# Altium project SEMG.PrjPcb
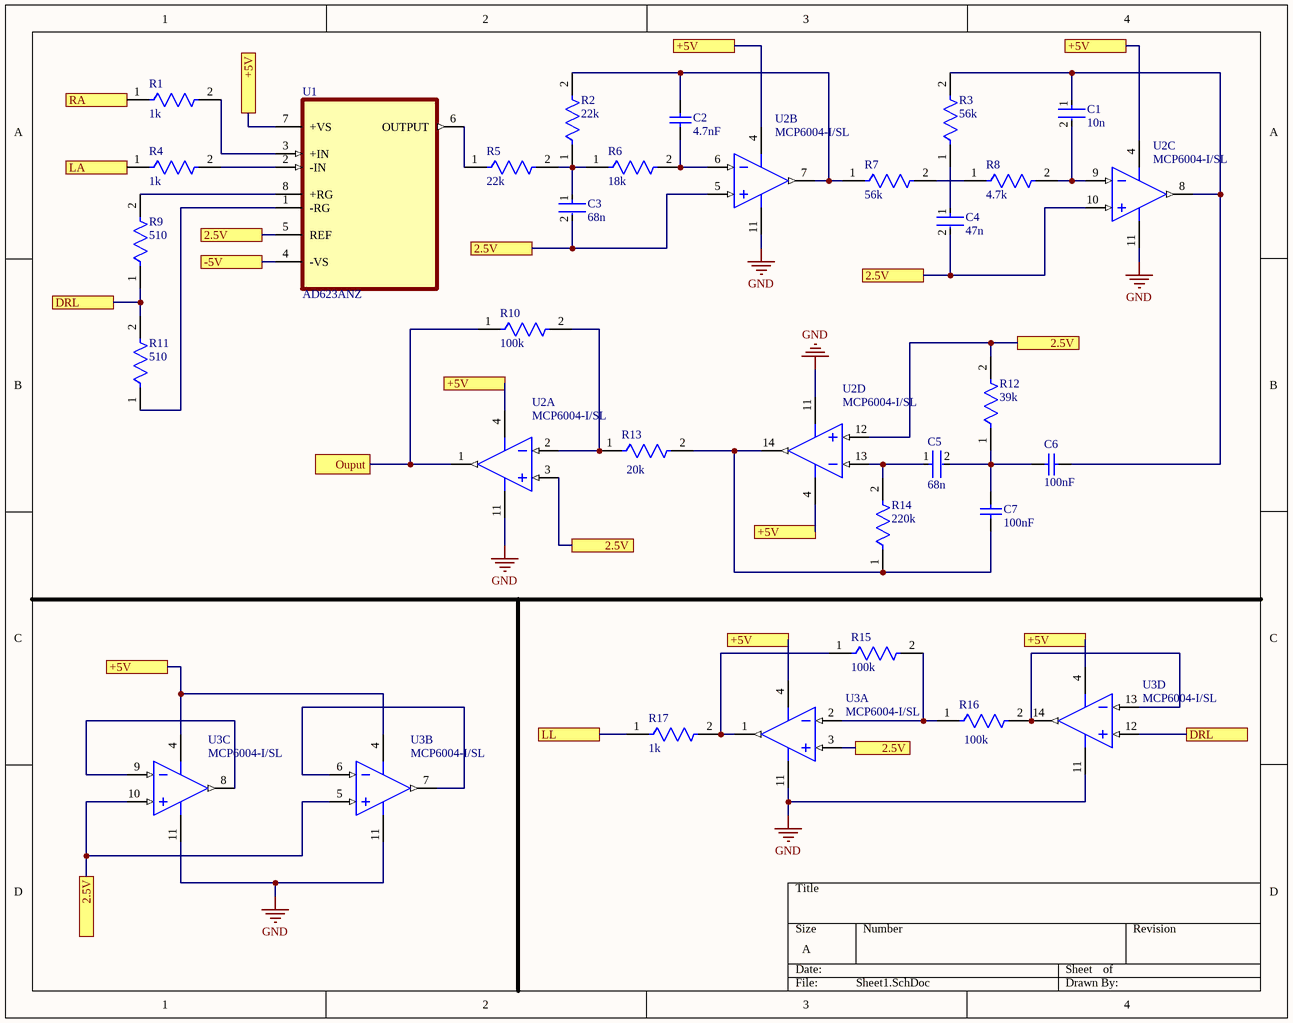
[diagram p0: Sheet1.SchDoc]
3 sheets, 69 parts. Net scope: flat (ports and power ports of the same name join across sheets).
Board file: PCB1.PcbDoc
Sheets:
  Sheet1.SchDoc
  Sheet2.SchDoc
  Sheet3.SchDoc

## Sheet Sheet1.SchDoc
size A; SheetNumber: 1; SheetTotal: 3

### Parts
C1  10n  [FP-C1206C-EB-MFG]
C2  4.7nF  [CAPC1206(3216)170_M]
C3  68n  [FP-C1206C-EB-MFG]
C4  47n  [FP-C1206C-EB-MFG]
C5  68n  [FP-C1206C-EB-MFG]
C6  100nF  [CAPC1210(3225)115_M]
C7  100nF  [CAPC1210(3225)115_M]
R1  1k  [FP-ESR03-IPC_A]
R2  22k  [FP-CRGP0603-IPC_C]
R3  56k  [FP-ESR03-IPC_C]
R4  1k  [FP-ESR03-IPC_A]
R5  22k  [FP-CRGP0603-IPC_C]
R6  18k  [FP-ESR03-MFG]
R7  56k  [FP-ESR03-IPC_C]
R8  4.7k  [FP-CRGP0603-IPC_C]
R9  510  [FP-ESR03-IPC_A]
R10  100k  [FP-CRGP0603-IPC_C]
R11  510  [FP-ESR03-IPC_A]
R12  39k  [FP-CRGP0603-IPC_C]
R13  20k  [FP-ESR03-IPC_A]
R14  220k  [FP-ESR03-MFG]
R15  100k  [FP-CRGP0603-IPC_C]
R16  100k  [FP-CRGP0603-IPC_C]
R17  1k  [FP-ESR03-IPC_A]
U1  AD623ANZ  [DIP254P762X533-8]
U2  MCP6004-I/SL  [SOIC-SL14_M]  (parts A,B,C,D of 4)
U3  MCP6004-I/SL  [SOIC-SL14_M]  (parts A,B,C,D of 4)

### Ports
2.5V, +5V, -5V, DRL, LA, LL, Ouput, RA

### Nets
GND: U2.11(VSS) U3.11(VSS)
NetC1_1: C1.1 C6.2 R3.2 U2.8(VOUTC)
NetC1_2: C1.2 R8.2 U2.9(VINC-)
NetC2_1: C2.1 R6.2 U2.6(VINB-)
NetC2_2: C2.2 R2.2 R7.1 U2.7(VOUTB)
NetC3_1: C3.1 R2.1 R5.2 R6.1
NetC3_2: C3.2 C4.2 R12.2 U1.5(REF) U2.3(VINA+) U2.5(VINB+) U2.10(VINC+) U2.12(VIND+) U3.3(VINA+) U3.5(VINB+) U3.10(VINC+) ; port 2.5V
NetC4_1: C4.1 R3.1
NetC5_1: C5.1 R14.2 U2.13(VIND-)
NetC5_2: C5.2 C6.1 C7.2 R12.1
NetC7_1: C7.1 R13.2 R14.1 U2.14(VOUTD)
NetC8_1: U1.7(+VS) U2.4(VDD) U3.4(VDD) ; port +5V
NetC16_2: U1.4(-VS) ; port -5V
NetJ1_7: R10.1 U2.1(VOUTA) ; port Ouput
NetJ4_1: R17.1 ; port LL
NetJ4_2: R4.1 ; port LA
NetJ4_3: R1.1 ; port RA
NetR1_2: R1.2 U1.3(+IN)
NetR4_2: R4.2 U1.2(-IN)
NetR5_1: R5.1 U1.6(OUTPUT)
NetR7_2: R7.2 R8.1
NetR9_1: R9.1 R11.2 U3.12(VIND+) ; port DRL
NetR9_2: R9.2 U1.8(+RG)
NetR10_2: R10.2 R13.1 U2.2(VINA-)
NetR11_1: R11.1 U1.1(-RG)
NetR15_1: R15.1 R17.2 U3.1(VOUTA)
NetR15_2: R15.2 R16.1 U3.2(VINA-)
NetR16_2: R16.2 U3.13(VIND-) U3.14(VOUTD)
NetU3_6: U3.6(VINB-) U3.7(VOUTB)
NetU3_8: U3.8(VOUTC) U3.9(VINC-)

### Library data of the parts
C1 = CMP-1037-03498-2: CAP CER 10000PF 50V NP0 1206; Manufacturer: KEMET; Manufacturer Part Number: C1206C103F5GACTU; Value: 10,000 pF; Material: Ceramic; Temperature Characteristic: C0G; Tolerance: 0.01; Automotive Grade: Grade 0; Temperature Coefficient: 15%; Digikey Description: CAP CER 10000PF 50V NP0 1206; Device Class L1: Passive Components; Device Class L2: Capacitors; Capacitance: 10,000 pF; Octopart: https://octopart.com/c1206c103f5gactu-kemet-19050582; Voltage Rating: 50 V; Height: 0.88mm; ComponentLink2Description: Datasheet; ComponentLink2URL: https://content.kemet.com/datasheets/KEM_C1007_X8R_ULTRA_150C_SMD.pdf; Lead Free: Yes; Temperature Range Low: -55°C; Ipc Land Pattern Name: CAPC320160X78; RoHS: TRUE; Temperature: -55°C to +150°C; Category: Cap; Package: C1206C-EB; Temperature Range High: +150°C; Automotive: Yes; Device Class L3: Ceramic Capacitors
C2 = CMP-1037-03108-1: CAP 4.7nF 50V ±1% 1206 (3216 Metric) Thickness 1.7mm SMD; Tolerance: Â±1%; Case-EIA: 1206; Case-Metric: 3216; Rated Voltage: 50 V; Technology: SMT; Value: 4.7nF; Max Thickness: 1.7 mm
C3 C5 = CMP-1037-04086-2: CAP CER 0.068UF 50V NP0 1206; Manufacturer Part Number: C1206C683F5GACTU; Manufacturer: KEMET; Temperature Characteristic: C0G; Tolerance: 0.01; Temperature Coefficient: 15%; Value: 68,000 pF; Automotive Grade: Grade 0; Material: Ceramic; ComponentLink2Description: Datasheet; Lead Free: Yes; Voltage Rating: 50 V; RoHS: TRUE; ComponentLink2URL: https://content.kemet.com/datasheets/KEM_C1007_X8R_ULTRA_150C_SMD.pdf; Device Class L2: Capacitors; Category: Cap; Height: 0.88mm; Device Class L3: Ceramic Capacitors; Mouser Description: Multilayer Ceramic Capacitors MLCC - SMD/SMT 50volts 0.068uF 1% C0G; Octopart: https://octopart.com/c1206c683f5gactu-kemet-19050752; Package: C1206C-EB; Automotive: Yes; Temperature Range High: +150°C; Temperature: -55°C to +150°C; Device Class L1: Passive Components; Digikey Description: CAP CER 0.068UF 50V NP0 1206; Capacitance: 68,000 pF; Ipc Land Pattern Name: CAPC320160X78; Temperature Range Low: -55°C
C4 = CMP-1037-03977-2: CAP CER 0.047UF 50V NP0 1206; Manufacturer: KEMET; Manufacturer Part Number: C1206C473F5GACTU; Tolerance: 0.01; Automotive Grade: Grade 0; Value: 47,000 pF; Material: Ceramic; Temperature Coefficient: 15%; Temperature Characteristic: C0G; Device Class L1: Passive Components; Lead Free: Yes; Voltage Rating: 50 V; ComponentLink2URL: https://content.kemet.com/datasheets/KEM_C1007_X8R_ULTRA_150C_SMD.pdf; Device Class L2: Capacitors; Capacitance: 47,000 pF; Temperature Range High: +150°C; RoHS: TRUE; Temperature Range Low: -55°C; Category: Cap; Mouser Description: Multilayer Ceramic Capacitors MLCC - SMD/SMT 50volts 0.047uF 1% C0G; Height: 0.88mm; Device Class L3: Ceramic Capacitors; ComponentLink2Description: Datasheet; Octopart: https://octopart.com/c1206c473f5gactu-kemet-13140371; Digikey Description: CAP CER 0.047UF 50V NP0 1206; Package: C1206C-EB; Automotive: Yes; Temperature: -55°C to +150°C; Ipc Land Pattern Name: CAPC320160X78
C6 C7 = CMP-1038-01632-1: CAP 100nF 16V ±1% 1210 (3225 Metric) Thickness 1.1mm SMD; Case-Metric: 3225; Tolerance: Â±1%; Case-EIA: 1210; Value: 100nF; Technology: SMT; Max Thickness: 1.1 mm; Rated Voltage: 16 V
R1 R4 R17 = CMP-08839-029483-1: 1kΩ ±1% 0.25W 0603 Anti-Surge Chip Resistor AEC-Q200; Power Rating: 250mW; Resistance: 1kR; Temperature Coefficient: 100ppm/°C; Series: ESR; Max Operating Temperature: 155°C; Case Code (Metric): 1608; Package Quantity: 1; Case/Package: 0603; Size Code: 0603; Case Code (Imperial): 0603; Min Operating Temperature: -55°C; Tolerance: 1%; Max Power Dissipation: 250mW; Number of Terminations: 2; RoHS Compliant: Yes; Lead Free: Lead Free; Packaging: Tape and Reel; Height: 0.022inch; Width: 0.031inch; Features: Automotive AEC-Q200; Resistor Type: Thick Film; Length: 0.063inch
R2 R5 = CMP-03211-006681-1: CRGP 0603 22K 1%; Manufacturer Part Number: CRGP0603F22K; Manufacturer: TE; Resistance: 22KΩ; Power Rating: 0.25W; Temperature Coefficient: ±100ppm/°C; Tolerance: 0.01; Voltage Rating: 50V; Value: 22KΩ; Lead Free: Yes; Device Class L3: Chip SMD Resistors; Ipc Land Pattern Name: RESC16080X45; Composition: Thick Film; Octopart: https://octopart.com/crgp0603f22k-te+connectivity-91018742; RoHS: TRUE; ComponentLink2Description: Datasheet; Digikey Description: CRGP 0603 22K 1%; Category: Res; Temperature: -55°C to +155°C; Temperature Range High: +155°C; Series: CRGP; ComponentLink2URL: https://www.te.com/commerce/DocumentDelivery/DDEController?Action=srchrtrv&DocNm=9-1773463-9&DocType=DS&DocLang=English; Device Class L2: Resistors; Height: 0.55mm; Ambient Temperature Range High: +70°C; Device Class L1: Passive Components; Automotive: No; Temperature Range Low: -55°C; Package: CRGP0603
R3 R7 = CMP-08839-002556-1: 56kΩ ±1% 0.25W 0603 Anti-Surge Chip Resistor AEC-Q200; Temperature Coefficient: 100ppm/°C; Max Power Dissipation: 250mW; Resistance: 56kR; Series: ESR; Packaging: Tape and Reel; Features: Automotive AEC-Q200; Min Operating Temperature: -55°C; Tolerance: 1%; RoHS Compliant: Yes; Case/Package: 0603; Resistor Type: Thick Film; Max Operating Temperature: 155°C; Number of Terminations: 2
R6 = CMP-08839-007579-1: 18kΩ ±1% 0.25W 0603 Anti-Surge Chip Resistor AEC-Q200; Temperature Coefficient: 100ppm/°C; Max Power Dissipation: 250mW; Resistance: 18kR; Max Operating Temperature: 155°C; Height: 0.022inch; Packaging: Tape and Reel; Package Quantity: 5000; Number of Terminations: 2; RoHS Compliant: Yes; Width: 0.031inch; Series: ESR03; Case/Package: 0603; Resistor Type: Thick Film; Min Operating Temperature: -55°C; Tolerance: 1%; Length: 0.063inch
R8 = CMP-03211-002408-1: CRGP0603 4.7KΩ 0.25W ±100ppm/°C 1% 50V; Manufacturer Part Number: CRGP0603F4K7; Manufacturer: TE; Tolerance: 0.01; Device Class L1: Passive Components; Temperature Range High: +155°C; Value: 4.7KΩ; ComponentLink2Description: Datasheet; Resistance: 4.7KΩ; RoHS: TRUE; Octopart: https://octopart.com/crgp0603f4k7-te+connectivity-91018764; Ipc Land Pattern Name: RESC16080X45; Lead Free: Yes; Temperature: -55°C to +155°C; Power Rating: 0.25W; Category: Res; Package: CRGP0603; Voltage Rating: 50V; ComponentLink2URL: https://www.te.com/commerce/DocumentDelivery/DDEController?Action=srchrtrv&DocNm=9-1773463-9&DocType=DS&DocLang=English; Temperature Coefficient: ±100ppm/°C; Height: 0.55mm; Automotive: No; Temperature Range Low: -55°C; Device Class L2: Resistors; Series: CRGP; Composition: Thick Film; Device Class L3: Chip SMD Resistors; Ambient Temperature Range High: +70°C
R9 = CMP-08839-005099-1: 510Ω ±1% 0.25W 0603 Anti-Surge Chip Resistor AEC-Q200; Resistance: 510R; Max Power Dissipation: 250mW; Temperature Coefficient: 100ppm/°C; Series: ESR; Min Operating Temperature: -55°C; Resistor Type: Thick Film; Case/Package: 0603; Packaging: Tape and Reel; Tolerance: 1%; Features: Automotive AEC-Q200; Number of Terminations: 2; Max Operating Temperature: 155°C
R10 R15 R16 = CMP-03211-000885-1: CRGP 0603 100K 1%; Manufacturer: TE; Manufacturer Part Number: CRGP0603F100K; Power Rating: 0.25W; Resistance: 100KΩ; Voltage Rating: 50V; Value: 100KΩ; Tolerance: 0.01; Temperature Coefficient: ±100ppm/°C; Device Class L2: Resistors; Temperature: -55°C to +155°C; Temperature Range High: +155°C; Ambient Temperature Range High: +70°C; Lead Free: Yes; RoHS: TRUE; Octopart: https://octopart.com/crgp0603f100k-te+connectivity-91018719; Digikey Description: CRGP 0603 100K 1%; Automotive: No; ComponentLink2Description: Datasheet; Category: Res; Ipc Land Pattern Name: RESC16080X45; Device Class L3: Chip SMD Resistors; Composition: Thick Film; Temperature Range Low: -55°C; Height: 0.55mm; Device Class L1: Passive Components; Series: CRGP; Package: CRGP0603; ComponentLink2URL: https://www.te.com/commerce/DocumentDelivery/DDEController?Action=srchrtrv&DocNm=9-1773463-9&DocType=DS&DocLang=English
R11 = CMP-08839-005099-1: Resistance: 510R; Max Power Dissipation: 250mW; Tolerance: 1%; Temperature Coefficient: 100ppm/°C; Series: ESR; Min Operating Temperature: -55°C; Resistor Type: Thick Film; Case/Package: 0603; Packaging: Tape and Reel; Features: Automotive AEC-Q200; Number of Terminations: 2; Max Operating Temperature: 155°C
R12 = CMP-03211-000998-1: CRGP0603 39KΩ 0.25W ±100ppm/°C 1% 50V; Manufacturer: TE; Manufacturer Part Number: CRGP0603F39K; Tolerance: 0.01; Package: CRGP0603; Temperature: -55°C to +155°C; Device Class L1: Passive Components; Value: 39KΩ; RoHS: TRUE; Device Class L3: Chip SMD Resistors; Octopart: https://octopart.com/crgp0603f39k-te+connectivity-91018756; Resistance: 39KΩ; Automotive: No; Lead Free: Yes; Height: 0.55mm; Category: Res; Series: CRGP; Temperature Range High: +155°C; Temperature Coefficient: ±100ppm/°C; Composition: Thick Film; Temperature Range Low: -55°C; ComponentLink2URL: https://www.te.com/commerce/DocumentDelivery/DDEController?Action=srchrtrv&DocNm=9-1773463-9&DocType=DS&DocLang=English; ComponentLink2Description: Datasheet; Device Class L2: Resistors; Ambient Temperature Range High: +70°C; Ipc Land Pattern Name: RESC16080X45; Power Rating: 0.25W; Voltage Rating: 50V
R13 = CMP-08839-029148-1: 20kΩ ±1% 0.25W 0603 Anti-Surge Chip Resistor AEC-Q200; Resistance: 20kR; Max Power Dissipation: 250mW; Temperature Coefficient: 100ppm/°C; Max Operating Temperature: 155°C; RoHS Compliant: Yes; Length: 0.063inch; Number of Terminations: 2; Tolerance: 1%; Height: 0.022inch; Width: 0.031inch; Case Code (Metric): 1608; Min Operating Temperature: -55°C; Case/Package: 0603; Case Code (Imperial): 0603; Packaging: Tape and Reel; Resistor Type: Thick Film; Package Quantity: 1; Features: Automotive AEC-Q200; Series: ESR
R14 = CMP-08839-027973-1: 220kΩ ±1% 0.25W 0603 Anti-Surge Chip Resistor AEC-Q200; Max Power Dissipation: 250mW; Temperature Coefficient: 100ppm/°C; Resistance: 220kR; Number of Terminations: 2; Packaging: Tape and Reel; Tolerance: 1%; Height: 0.022inch; Case Code (Imperial): 0603; Min Operating Temperature: -55°C; Package Quantity: 1; Features: Automotive AEC-Q200; Resistor Type: Thick Film; RoHS Compliant: Yes; Width: 0.031inch; Length: 0.063inch; Max Operating Temperature: 155°C; Series: ESR; Case/Package: 0603; Case Code (Metric): 1608
U1 = AD623ANZ: Single and Dual-Supply, Rail-to-Rail, Low Cost Instrumentation Amplifier; MF: Analog Devices; SnapEDA_Link: https://www.snapeda.com/parts/AD623ANZ/Analog+Devices/view-part/?ref=snap; Package: PDIP-8 Analog Devices; Value: *; MP: AD623ANZ; Check_prices: https://www.snapeda.com/parts/AD623ANZ/Analog+Devices/view-part/?ref=eda
U2 U3 = CMP-0187-00321-3: None; Number of Channels: 4; Amplifier Type: GENERAL PURPOSE; Common Mode Rejection Ratio: 60dB; Bandwidth: 1MHz; Voltage Gain: 112dB; Min Supply Voltage: 1.8V; Slew Rate-Nom: 0.6V/µs; Supply Current: 100uA; Input Offset Voltage-Max: 4.5mV; Power Supply Rejection Ratio (PSRR): 86dB; Output Current: 23mA; Operating Supply Voltage: 5.5V; Input Bias Current: 1pA; Max Supply Voltage: 6V; RoHS Compliant: Yes; Technology: CMOS; Radiation Hardening: No; Number of Elements: 4; REACH SVHC: No SVHC; Number of Amplifiers: 4; Lead Free: Lead Free; Contact Plating: Tin; Max Operating Temperature: 85°C; Packaging: Rail/Tube; Number of Pins: 14; Case/Package: SOIC; Width: 3.9mm; Length: 8.65mm; Unity Gain Bandwidth Product: 1MHz; Gain Bandwidth Product: 1MHz; Input Offset Voltage (Vos): 4.5mV; Package Quantity: 57; Number of Circuits: 4; Min Operating Temperature: -40°C; Nominal Supply Current: 100uA; Height: 1.25mm; Slew Rate: 0.6V/µs; Mount: Surface Mount

## Sheet Sheet2.SchDoc
size A; SheetNumber: 2; SheetTotal: 3
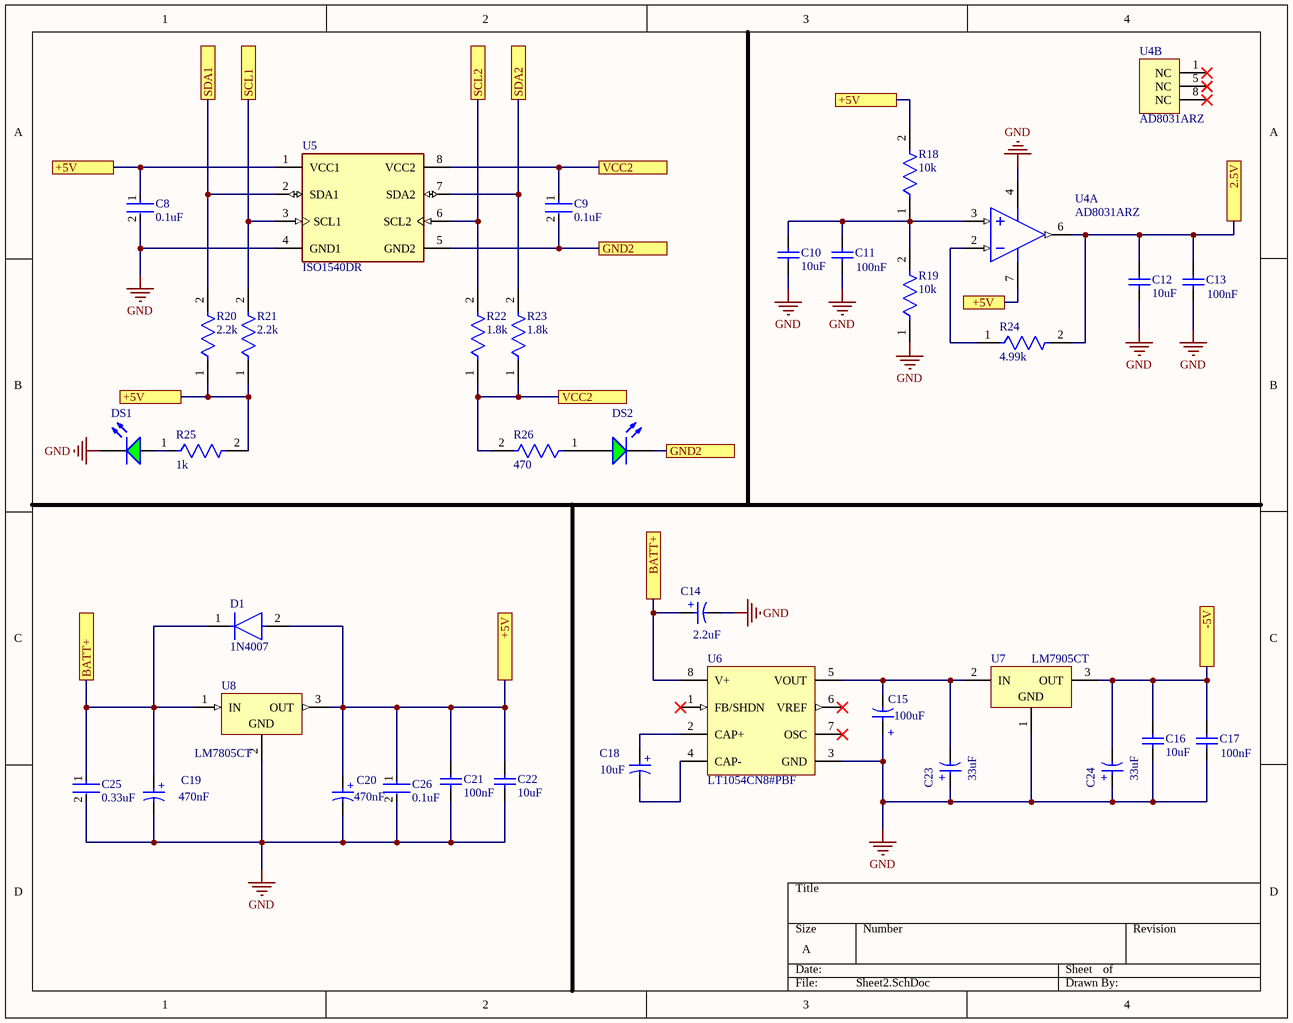
[diagram p1: Sheet2.SchDoc]

### Parts
C8  0.1uF  [FP-C1206C-EB-MFG]
C9  0.1uF  [FP-C1206C-EB-MFG]
C10  10uF  [CAPC1210(3225)230_M]
C11  100nF  [CAPC1210(3225)190_L]
C12  10uF  [CAPC1210(3225)230_M]
C13  100nF  [CAPC1210(3225)190_L]
C14  2.2uF  [WCAP-ATG8_D5H11]
C15  100uF  [WCAP-PTG5_D8H11.5]
C16  10uF  [CAPC1210(3225)230_M]
C17  100nF  [CAPC1210(3225)190_L]
C18  10uF  [WCAP-ATG5_D5H11]
C19  470nF  [WCAP-ATG5_D5H11]
C20  470nF  [WCAP-ATG5_D5H11]
C21  100nF  [CAPC1210(3225)190_L]
C22  10uF  [CAPC1210(3225)230_M]
C23  33uF  [WCAP-ATG5_D5H11]
C24  33uF  [WCAP-ATG5_D5H11]
C25  0.33uF  [FP-C0805C-DN-MFG]
C26  0.1uF  [FP-C1206C-EB-MFG]
D1  1N4007  [FP-1N4007-MFG]
DS1  (no value)  [LTST-C230KGKT_V]
DS2  (no value)  [LTST-C230KGKT_V]
R18  10k  [FP-ERJPA3-IPC_A]
R19  10k  [FP-ERJPA3-IPC_A]
R20  2.2k  [FP-ESR03-IPC_C]
R21  2.2k  [FP-ESR03-IPC_C]
R22  1.8k  [FP-ESR03-IPC_C]
R23  1.8k  [FP-ESR03-IPC_C]
R24  4.99k  [FP-AC1206-MFG]
R25  1k  [FP-ESR03-IPC_A]
R26  470  [FP-CRGP0603-IPC_C]
U4  AD8031ARZ  [ADI-R-8_L]  (parts A,B of 2)
U5  ISO1540DR  [FP-D0008A-MFG]
U6  LT1054CN8#PBF  [LT-N8-8]
U7  LM7905CT  [NDE0003A]
U8  LM7805CT  [FAIR-TO-220-3]

### Ports
2.5V, +5V, -5V, BATT+, GND2, SCL1, SCL2, SDA1, SDA2, VCC2

### Nets
GND: C8.2 C10.1 C11.1 C12.1 C13.1 C14.2(N) C15.1(P) C16.1 C17.1 C19.2(N) C20.2(N) C21.1 C22.1 C23.1(P) C24.1(P) C25.2 C26.2 DS1.2(K) R19.1 U4.4(-VS) U5.4(GND1) U6.3(GND) U7.1(GND) U8.2(GND)
NetC3_2: C12.2 C13.2 R24.2 U4.6(OUT) ; port 2.5V
NetC8_1: C8.1 C20.1(P) C21.2 C22.2 C26.1 D1.2(A) R18.2 R20.1 R21.1 R25.2 U4.7(+VS) U5.1(VCC1) U8.3(OUT) ; port +5V
NetC9_1: C9.1 R22.1 R23.1 R26.2 U5.8(VCC2) ; port VCC2
NetC9_2: C9.2 DS2.2(K) U5.5(GND2) ; port GND2
NetC10_2: C10.2 C11.2 R18.1 R19.2 U4.3(+IN)
NetC14_1: C14.1(P) C19.1(P) C25.1 D1.1(C) U6.8(V+) U8.1(IN) ; port BATT+
NetC15_2: C15.2(N) C23.2(N) U6.5(VOUT) U7.2(IN)
NetC16_2: C16.2 C17.2 C24.2(N) U7.3(OUT) ; port -5V
NetC18_1: C18.1(P) U6.2(CAP+)
NetC18_2: C18.2(N) U6.4(CAP-)
NetDS1_1: DS1.1(A) R25.1
NetDS2_1: DS2.1(A) R26.1
NetJ1_3: R21.2 U5.3(SCL1) ; port SCL1
NetJ1_4: R20.2 U5.2(SDA1) ; port SDA1
NetJ3_3: R23.2 U5.7(SDA2) ; port SDA2
NetJ3_4: R22.2 U5.6(SCL2) ; port SCL2
NetR24_1: R24.1 U4.2(-IN)

Not connected (* = marked no-connect by the designer): U4 1(NC)* 5(NC)* 8(NC)*; U6 1(FB/SHDN)* 6(VREF)* 7(OSC)*

### Notes on the sheet
- (in symbol CMP-03913-53914227-2) +
- (in symbol CMP-03913-53914235-2) +
- (in symbol CMP-03913-53914252-2) +
- (in symbol CMP-03913-54007285-2) +
- (in symbol CMP-03913-54202572-2) +

### Library data of the parts
C8 C9 C26 = CMP-03020-004485-1: C1206 0.10 μF U2J 1.00% 25 V; Manufacturer: KEMET; Manufacturer Part Number: C1206C104F3JACAUTO; Value: 0.10 μF; Material: Ceramic; Voltage Rating: 25 V; Tolerance: 0.01; Temperature Coefficient: 15%; Automotive Grade: Grade 0; Temperature Range Low: -55°C; Temperature: -55°C to +150°C; Octopart: https://octopart.com/c1206c104f3jacauto-kemet-84732508; Device Class L3: Ceramic Capacitors; Category: Cap; Device Class L1: Passive Components; Package: C1206C-EB; Device Class L2: Capacitors; Height: 0.88mm; Automotive: Yes; Ipc Land Pattern Name: CAPC320160X78; Temperature Range High: +150°C; Capacitance: 0.10 μF; RoHS: TRUE; Temperature Characteristic: U2J; ComponentLink2Description: Datasheet; Lead Free: Yes; ComponentLink2URL: https://content.kemet.com/datasheets/KEM_C1007_X8R_ULTRA_150C_SMD.pdf
C10 C12 C16 C22 = CMP-1038-02200-3: CAP 10uF 10V ±20% 1210 (3225 Metric) Thickness 2.2mm SMD; Tolerance: Â±20%; Case-Metric: 3225; Case-EIA: 1210; Max Thickness: 2.2 mm; Technology: SMT; Value: 10uF; Rated Voltage: 10 V
C11 C13 C17 C21 = CMP-1038-01673-1: CAP 100nF 100V ±20% 1210 (3225 Metric) Thickness 1.9mm SMD; Case-EIA: 1210; Case-Metric: 3225; Tolerance: Â±20%; Technology: SMT; Max Thickness: 1.9 mm; Rated Voltage: 100 V; Value: 100nF
C14 = CMP-03913-54007285-2: WCAP-ATG8 Aluminum Electrolytic Capacitors; Manufacturer Lifecycle Status: ACTIVE; Life (Hours): 2000hours; Voltage Rating (DC): 63V; Leakage Current: 3µA; Pitch: 2mm; Polarity: Polar; YEOL: 1 = Estimated lifetime > 10 years; Ripple Current: 31mA; Capacitance: 2.2µF; Tolerance: 20%; Length: 11mm; Mount: Through Hole; RoHS: Compliant; REACH SVHC: Unknown; Lifecycle Status: Production; Height - Seated (Max): 12.4968mm; Min Operating Temperature: -40°C; Height: 11mm; Diameter: 5mm; Packaging: Tape & Box (TB); Lead Pitch: 2.0066mm; Max Operating Temperature: 85°C; Case/Package: Radial; Voltage Rating: 63V
C15 = CMP-03913-54202572-2: WCAP-PTG5 Aluminum Polymer Capacitors; Manufacturer Lifecycle Status: ACTIVE; Tolerance: 20%; YEOL: 1 = Estimated lifetime > 10 years; Pitch: 3.5mm; ESR (Equivalent Series Resistance): 12mΩ; Voltage Rating (DC): 16V; Life (Hours): 2000hours; Polarity: Polar; Capacitance: 100µF; Ripple Current: 4.8A; Leakage Current: 160µA; Mount: Through Hole; Case/Package: Radial; Min Operating Temperature: -55°C; Max Operating Temperature: 105°C; REACH SVHC: Unknown; RoHS: Compliant; Lead Pitch: 3.5052mm; Height - Seated (Max): 13.0048mm; Packaging: Tape & Box (TB); Voltage Rating: 16V; Diameter: 8mm; Length: 11.5mm; Lifecycle Status: Production
C18 = CMP-03913-53914252-2: WCAP-ATG5 Aluminum Electrolytic Capacitors; Manufacturer Lifecycle Status: ACTIVE; Leakage Current: 6.3µA; Material: Aluminium; Life (Hours): 2000hours; Polarity: Polar; Ripple Current: 42mA; Pitch: 2mm; Tolerance: 20%; Capacitance: 10µF; Voltage Rating: 63V; YEOL: 1 = Estimated lifetime > 10 years; Min Operating Temperature: -40°C; Case/Package: Radial; Length: 11mm; Mount: Through Hole; Height: 11mm; Diameter: 5mm; Packaging: Tape & Box (TB); REACH SVHC: Unknown; RoHS: Compliant; Height - Seated (Max): 12.4968mm; Lifecycle Status: Production; Voltage Rating (DC): 63V; Lead Pitch: 2.0066mm; Max Operating Temperature: 105°C
C19 C20 = CMP-03913-53914227-2: WCAP-ATG5 Aluminum Electrolytic Capacitors; Leakage Current: 3µA; Pitch: 2mm; Polarity: Polar; Life (Hours): 2000hours; Voltage Rating: 50V; Ripple Current: 7mA; Tolerance: 20%; Length: 11mm; Lead Pitch: 2.0066mm; RoHS: Compliant; Min Operating Temperature: -40°C; Case/Package: Radial; Height - Seated (Max): 12.4968mm; Packaging: Tape & Box (TB); Max Operating Temperature: 105°C; Capacitance: 470nF; REACH SVHC: Unknown; Voltage Rating (DC): 50V; Diameter: 5mm; Mount: Through Hole; Height: 11mm
C23 C24 = CMP-03913-53914235-2: WCAP-ATG5 Aluminum Electrolytic Capacitors; Capacitance: 33µF; Voltage Rating: 50V; Polarity: Polar; Life (Hours): 2000hours; Pitch: 2mm; Leakage Current: 16.5µA; Tolerance: 20%; Material: Aluminium; Ripple Current: 75mA; Max Operating Temperature: 105°C; Length: 11mm; REACH SVHC: Unknown; Case/Package: Radial; Mount: Through Hole; Diameter: 5mm; Min Operating Temperature: -40°C; Packaging: Tape & Box (TB); Height: 11mm; Voltage Rating (DC): 50V; RoHS: Compliant; Lead Pitch: 2.0066mm; Height - Seated (Max): 12.4968mm
C25 = CMP-2007-03276-2: CAP CER 0.33UF 25V X7R 0805; Manufacturer: KEMET; Manufacturer Part Number: C0805C334J3RACTU; Value: 0.33 μF; Material: Ceramic; Tolerance: 0.05; Temperature Coefficient: 30ppm/°C; Mouser Description: Capacitor, Ceramic, 330000Pf, 25Vdc, 5-% Tol, 5+% Tol, X7r-Tc Code, -15, 15%-Tc; Package: C0805C-DN; ComponentLink2URL: https://content.kemet.com/datasheets/KEM_C1003_C0G_SMD.pdf; RoHS: TRUE; Capacitance: 0.33 μF; Temperature: -55°C to +125°C; ComponentLink2Description: Datasheet; Temperature Range Low: -55°C; Automotive: No; Ipc Land Pattern Name: CAPC200125X78; Temperature Characteristic: X7R; Device Class L3: Ceramic Capacitors; Digikey Description: CAP CER 0.33UF 25V X7R 0805; Voltage Rating: 25 V; Device Class L1: Passive Components; Height: 0.88mm; Octopart: https://octopart.com/c0805c334j3ractu-kemet-9143333; Device Class L2: Capacitors; Category: Cap; Temperature Range High: +125°C; Lead Free: Yes
D1 = CMP-123542-000001-1: Rectifier diode 1000 V 1 A DO-41, ,; Manufacturer: Diotec; Max Surge Forward Current: 27A; Forward Current: 1A; Max Junction Temp: +175°C; Reverse Voltage: 1000V; Value: 15pF; Peak Reverse Current: 5uA; Category: Diode; Temperature Range Low: -50°C; Automotive: No; Temperature: -50°C to +175°C; Lead Free: Yes; ComponentLink2Description: Datasheet; Max Repetitive Reverse Voltage: 1000V; ComponentLink2URL: https://datasheet.octopart.com/1N4007-Diotec-datasheet-62346875.pdf; Manufacturer Part Number: 1N4007; Device Class L3: Rectifier Diodes; Height: 2.8mm; Octopart: https://octopart.com/1n4007-diotec-4040411; Package: 1N4007; Temperature Range High: +175°C; Device Class L1: Discrete Semiconductors; Device Class L2: Diodes; RoHS: TRUE; Capacitance: 15pF; Ipc Land Pattern Name: DIOAD888W100L520D280
DS1 DS2 = CMP-2000-06625-1: LED Green, 75 mW, 30 mA, -30 to 85 degC, 2-Pin SMD, RoHS, Tape and Reel; Manufacturer: Lite-On; Product Length (mm): 3.2mm; Type: Uni-Color; Peak Wavelength: 574nm; Shape Type: Rectangular; DELETED: Compliant; Lum Intensity: 35mcd; Forward Voltage: 2.4V; High Brightness: Yes; Rad Hardened: No; Power Dissipation: 75W; Forward Current: 30mA; Emitting Color: YellowGreen; Main Category: ChipLED; Product Height (mm): 1.1mm; Product Depth (mm): 1.6mm; Number of  Elements: 1; Viewing Angle: 130deg; Chip Material: AlGaInP; Dominant Wave Length: 571nm; Test Current (It): 20mA; Reverse Voltage: 5V; Mounting: SurfaceMount; Datasheet URL: http://optoelectronics.liteon.com/upload/download/DS22-2000-256/S_110_LTST-C230KGKT.pdf; Luminous Intensity: 35mcd; Pin Count: 2; Mounting Technology: SurfaceMount; Operating Temperature Classification: Industrial; Operating Temp Range: -55Cto85C; Package Type: ChipLed; Manufacturer URL: http://www.us.liteon.com/; Package Description: 2-Pin Surface Mount Device, Body 3.2 x 1.6 mm; Package Reference: C230KGKT; Datasheet Version: Rev. G, 12/2014; Lens Dimensions: 1.5X1.6X0.82mm; Packaging: TapeandReel
R18 R19 = CMP-05422-000155-1: RES SMD 10K OHM 1% 1/3W 0603; RoHS Compliant: Yes
R20 R21 = CMP-08839-028338-1: 2.2kΩ ±1% 0.25W 0603 Anti-Surge Chip Resistor AEC-Q200; Max Power Dissipation: 250mW; Temperature Coefficient: 100ppm/°C; Resistance: 2.2kR; Package Quantity: 5000; Series: ESR03; RoHS Compliant: Yes; Tolerance: 1%; Height: 0.022inch; Case/Package: 0603; Width: 0.031inch; Packaging: Tape and Reel; Number of Terminations: 2; Resistor Type: Thick Film; Max Operating Temperature: 155°C; Min Operating Temperature: -55°C; Length: 0.063inch
R22 R23 = CMP-08839-006074-1: 1.8kΩ ±1% 0.25W 0603 Anti-Surge Chip Resistor AEC-Q200; Temperature Coefficient: 100ppm/°C; Resistance: 1.8kR; Max Power Dissipation: 250mW; Length: 0.063inch; Number of Terminations: 2; RoHS Compliant: Yes; Min Operating Temperature: -55°C; Packaging: Tape and Reel; Width: 0.031inch; Case/Package: 0603; Max Operating Temperature: 155°C; Tolerance: 1%; Resistor Type: Thick Film; Series: ESR03; Package Quantity: 5000; Height: 0.022inch
R24 = CMP-03412-034001-1: RES SMD 4.99K OHM 1% 1/4W 1206; Manufacturer: Yageo; Manufacturer Part Number: AC1206FR-074K99L; Resistance: 4.99KΩ; Power Rating: 0.25W; Tolerance: 0.01; Value: 4.99KΩ; Automotive Grade: Grade 0; Voltage Rating: 200V; Composition: Thick Film; ComponentLink2Description: Datasheet; Height: 0.65mm; Device Class L2: Resistors; Footprint Url: http://www.yageo.com/exep/pages/download/literatures/PYu-R_Mount_10.pdf; Ipc Land Pattern Name: RESC310160X55; Temperature Range High: +155°C; Octopart: https://octopart.com/ac1206fr-074k99l-yageo-30511146; Lead Free: Yes; ComponentLink2URL: http://www.yageo.com/NewPortal/yageodocoutput?fileName=/pdf/R-Chip/PYu-AC_51_RoHS_L_6.pdf; Temperature Range Low: -55°C; Temperature: -55°C to +155°C; Automotive: Yes; Digikey Description: RES SMD 4.99K OHM 1% 1/4W 1206; Series: AC; Device Class L1: Passive Components; Package: AC1206; Category: Res; RoHS: TRUE; Device Class L3: Chip SMD Resistors
R25 = CMP-08839-029483-1: as R1 on sheet Sheet1; Series: ESR; Max Operating Temperature: 155°C; Case Code (Metric): 1608; Package Quantity: 1; Case/Package: 0603; Size Code: 0603; Case Code (Imperial): 0603; Min Operating Temperature: -55°C; Tolerance: 1%; Max Power Dissipation: 250mW; Number of Terminations: 2; RoHS Compliant: Yes; Lead Free: Lead Free; Packaging: Tape and Reel; Height: 0.022inch; Width: 0.031inch; Features: Automotive AEC-Q200; Resistor Type: Thick Film; Length: 0.063inch
R26 = CMP-03211-005136-1: CRGP0603 470Ω 0.25W ±100ppm/°C 1% 50V; Manufacturer Part Number: CRGP0603F470R; Manufacturer: TE; Tolerance: 0.01; Ipc Land Pattern Name: RESC16080X45; Device Class L1: Passive Components; Temperature Range Low: -55°C; RoHS: TRUE; Composition: Thick Film; Temperature: -55°C to +155°C; ComponentLink2URL: https://www.te.com/commerce/DocumentDelivery/DDEController?Action=srchrtrv&DocNm=9-1773463-9&DocType=DS&DocLang=English; Series: CRGP; Package: CRGP0603; Resistance: 470Ω; Temperature Coefficient: ±100ppm/°C; Height: 0.55mm; Power Rating: 0.25W; Device Class L3: Chip SMD Resistors; Ambient Temperature Range High: +70°C; Lead Free: Yes; Category: Res; Device Class L2: Resistors; ComponentLink2Description: Datasheet; Value: 470Ω; Voltage Rating: 50V; Octopart: https://octopart.com/crgp0603f470r-te+connectivity-91018761; Automotive: No; Temperature Range High: +155°C
U4 = CMP-0384-01181-2: Single Channel RRIO Operational Amplifier, 80 MHz BW, 35 V/us SR, Industrial, 8-pin SOIC (R-8), Tube; Generic Part Number: AD8031; Manufacturer: Analog Devices; Iq/Amp: 900uA; V Span Max: 12V; Amplifiers Per Package: 1; Input Bias Current: 450nA; Slew Rate: 35V/us; Input Offset Voltage: 1mV; V Span Min: 2.7V; Small Signal Bandwidth: 80MHz; ComponentLink3URL: http://www.analog.com/static/imported-files/packages/PKG_PDF/SOIC_Narrow%20(R)/R_8.pdf; ComponentLink2Description: Datasheet; Mounting Technology: Surface Mount; Packing: Tube; ComponentLink3Description: Package Specification; PackageVersion: 060506-A; PartNumber: AD8031ARZ; RevisionNote: Reference Circuit URL fixed; ComponentLink2URL: http://www.analog.com/static/imported-files/data_sheets/AD8031_8032.pdf; PackageReference: R-8; ComponentLink1URL: http://www.analog.com/en/index.html; PackageDescription: 8-Pin Standard Small Outline Package, Body 3.9 x 4.9 mm, Pitch 1.27 mm; ComponentLink4URL: http://www.analog.com/en/all-operational-amplifiers-op-amps/operational-amplifiers-op-amps/ad8031/products/product.html#product-recommendations; Code_JEDEC: MS-012-AA; ComponentLink4Description: Reference Circuit; ComponentLink1Description: Manufacturer URL; DatasheetVersion: Rev. D
U5 = CMP-04872-000011-1: DGTL ISO 2.5KV 2CH I2C 8SOIC; Manufacturer: Texas Instruments; Max Supply Voltage: 5.5V; Interface: I2C,SMBus,Other; Nominal Supply Current: 1.7-3.1mA; Standoff Height: 0.11mm; Max Junction Temp: +136°C; Min Supply Voltage: 3V; Ipc Land Pattern Name: SOIC127P600X175-8; Ambient Temperature Range Low: -40°C; Temperature: -40°C to +125°C; Device Class L3: unset; Mouser Description: Digital Isolators Low-Power,Bidirec I2C Iso; Manufacturer Part Number: ISO1540DR; Octopart: https://octopart.com/iso1540dr-texas+instruments-24334113; Digikey Description: DGTL ISO 2.5KV 2CH I2C 8SOIC; Category: IC; Height: 1.75mm; Ambient Temperature Range High: +125°C; RoHS: TRUE; Automotive: No; Package: D0008A; ComponentLink2URL: http://www.ti.com/lit/ds/symlink/iso1540.pdf; Device Class L2: Interface ICs; Device Class L1: Integrated Circuits (ICs); Temperature Range Low: -40°C; Lead Free: Yes; ComponentLink2Description: Datasheet; Temperature Range High: +125°C
U6 = CMP-0475-00280-1: Switched-Capacitor Voltage Converter with Regulator, 3.5 to 15 V Vin, Adjustable Vout, 8-pin DIP (N8-8), 0 to 100 degC, Pb-Free; Manufacturer: Linear Technology; Voutput: Adj; Vin Max(V): 15; Isupply(mA): 2.5; Vin Min(V): 3.5; Frequency(kHz): 25; Ishutdown(uA): 100; PackageDescription: 8-Pin PDIP, Body 10.16 x 6.48 mm, Pitch 2.54 mm; DatasheetVersion: Rev. G; RoHS: TRUE; PackageReference: N8-8; ComponentLink1URL: http://www.linear.com/; PartNumber: LT1054CN8#PBF; ComponentLink2URL: http://cds.linear.com/docs/en/datasheet/1054lfg.pdf; PackageVersion: Rev. I, 07/2011; ComponentLink3URL: http://www.linear.com/docs/en/packaging/05081510_I_N8.pdf; Mounting Technology: Through Hole; Max Iout(mA): 100; ComponentLink3Description: Package Specification; ComponentLink2Description: Datasheet; ComponentLink1Description: Manufacturer URL
U7 = CMP-0062-02480-3: 3-Terminal Negative Regulator, 3-pin TO-220; Manufacturer: Texas Instruments; PowerWise: N; PackageTopMarking: NSUZXYTTE#*LM7905CT; CompType: LDO IC; PinCount: 3; PackageReference: NDE0003A; PackageDescription: TO-220, Molded, 3 Lead, Straight; ComponentLink1URL: http://www.ti.com/general/docs/lit/getliterature.tsp?genericPartNumber=LM7905&fileType=pdf; RoHS: N; ComponentLink1Description: Datasheet URL
U8 = CMP-2000-04938-1: Positive Voltage Regulator, 5 V, 1 A, -40 to 125 degC, 3-Pin TO-220, RoHS, Tube; Manufacturer: FairchildSemiconductor; Maximum Input Voltage: 35V; Maximum Quiescent Current: 8mA; Load Regulation: 100mV; Maximum Output Current: 2.2(Typ)A; Output Type: Fixed; Typical Dropout Voltage @ Current: 2@1AV; Rad Hard: No; Output Voltage: 5V; Accuracy: ±4%; Number of Outputs: 1; Category: LinearRegulator; Package Description: 3-Pin Through Hole Device, Body 10 x 4.5 mm, Pitch 2.54 mm; Packaging: Rail/Tube; Mounting: ThroughHole; Polarity: Positive; Manufacturer URL: https://www.fairchildsemi.com/; Line Regulation: 100mV; Datasheet Version: Aug-12; Datasheet URL: https://datasheet.ciiva.com/26904/lm7805ct-26904988.pdf; Package Reference: TO-220; Package URL: https://www.fairchildsemi.com/package-drawings/TO/TO220B03.pdf; Package: 3TO-220AB; Operating Temperature: -40to125degC; Type: Linear

## Sheet Sheet3.SchDoc
size A; SheetNumber: 3; SheetTotal: 3
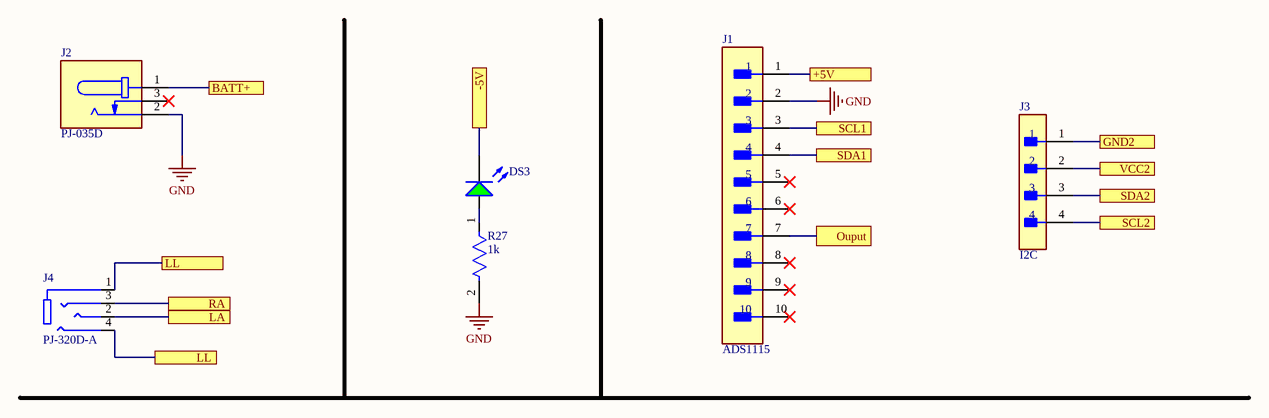
[diagram p2: Sheet3.SchDoc]

### Parts
DS3  (no value)  [LTST-C230KGKT_V]
J1  ADS1115  [FP-TS-110-T-A-MFG]
J2  PJ-035D  [CUI_PJ-035D]
J3  I2C  [FP-TSW-104-23-T-S-MFG]
J4  PJ-320D-A  [HRO_PJ-320D-A]
R27  1k  [FP-ESR03-IPC_A]

### Ports
+5V, -5V, BATT+, GND2, LA, LL, Ouput, RA, SCL1, SCL2, SDA1, SDA2, VCC2

### Nets
GND: J1.2 J2.2 R27.2
NetC8_1: J1.1 ; port +5V
NetC9_1: J3.2 ; port VCC2
NetC9_2: J3.1 ; port GND2
NetC14_1: J2.1 ; port BATT+
NetC16_2: DS3.2(K) ; port -5V
NetDS3_1: DS3.1(A) R27.1
NetJ1_3: J1.3 ; port SCL1
NetJ1_4: J1.4 ; port SDA1
NetJ1_7: J1.7 ; port Ouput
NetJ3_3: J3.3 ; port SDA2
NetJ3_4: J3.4 ; port SCL2
NetJ4_1: J4.1(SLEEVE) J4.4(RING2) ; port LL
NetJ4_2: J4.2(TIP) ; port LA
NetJ4_3: J4.3(RING1) ; port RA

Not connected (* = marked no-connect by the designer): J1 5* 6* 8* 9* 10*; J2 3*

### Library data of the parts
DS3 = CMP-2000-06625-1: as DS1 on sheet Sheet2; Mounting: SurfaceMount; Datasheet URL: http://optoelectronics.liteon.com/upload/download/DS22-2000-256/S_110_LTST-C230KGKT.pdf; Luminous Intensity: 35mcd; Pin Count: 2; Mounting Technology: SurfaceMount; Operating Temperature Classification: Industrial; Operating Temp Range: -55Cto85C; Package Type: ChipLed; Manufacturer URL: http://www.us.liteon.com/; Package Description: 2-Pin Surface Mount Device, Body 3.2 x 1.6 mm; Package Reference: C230KGKT; Datasheet Version: Rev. G, 12/2014; Lens Dimensions: 1.5X1.6X0.82mm; Packaging: TapeandReel
J1 = CMP-02766-000078-1: CONN HEADER VERT 10POS 2.54MM; Manufacturer Part Number: TS-110-T-A; Manufacturer: SAMTEC; Conn Orientation: Straight; Number Of Contacts: 10; Conn Gender: Male; Automotive: No; Digikey Description: CONN HEADER VERT 10POS 2.54MM; Temperature Range Low: -55°C; Number Of Rows: 1; Contact Material: Tin,Copper; Device Class L2: Headers and Wire Housings; Device Class L3: unset; ComponentLink2Description: Datasheet; RoHS: TRUE; Octopart: https://octopart.com/ts-110-t-a-samtec-275237; Category: Conn; Package: 0; Height: 8.16mm; Lead Free: Yes; Device Class L1: Connectors; Temperature Range High: +105°C; Temperature: -55°C to +105°C; Pitch: 2.54mm; ComponentLink2URL: http://suddendocs.samtec.com/prints/tx-1xx-x-x-mkt1.pdf; Footprint Url: http://suddendocs.samtec.com/prints/tx-1xx-x-x-footprint.pdf
J2 = PJ-035D: Power Barrel Connector Jack 1.30mm ID (0.051), 3.50mm OD (0.138) Through Hole, Right Angle; MF: Same Sky; MP: PJ035D; SnapEDA_Link: https://www.snapeda.com/parts/PJ035D/Same+Sky/view-part/?ref=snap; Package: None; Value: *; Check_prices: https://www.snapeda.com/parts/PJ035D/Same+Sky/view-part/?ref=eda
J3 = CMP-02766-001388-1: CONN HEADER VERT 4POS 2.54MM; Number of Contacts: 4; Gender: Male; Connector Type: Male Pin; Max Voltage Rating (AC): 550V; Max Current Rating: 7.6A; Radiation Hardening: No; Lead Free: Lead Free; RoHS Compliant: Yes; Contact Material: Bronze; Number of Positions: 4; Housing Color: Black; Min Operating Temperature: -55°C; Mount: Through Hole; Number of Rows: 1; Orientation: Straight; Contact Mating Length: 0.23inch; Contact Type: Male Pin; REACH SVHC: No SVHC; Max Operating Temperature: 105°C; Color: Black; Pitch: 2.54mm; Length: 10.16mm; Series: TSW; Packaging: Bulk; Contact Plating: Tin; Package Quantity: 1; Termination: Solder; Housing Material: Polyester; Width: 2.54mm; Depth: 2.54mm
J4 = PJ-320D-A: Headphone jack 0.5A 30V DC 100 mÎ©; MF: HRO Electronics Co., Ltd.; Package: Package; MP: PJ-320D-A; Check_prices: https://www.snapeda.com/parts/PJ-320D-A/HRO+Electronics+Co.%252C+Ltd./view-part/?ref=eda; Value: *; Availability: Not in stock; Price: None; SnapEDA_Link: https://www.snapeda.com/parts/PJ-320D-A/HRO+Electronics+Co.%252C+Ltd./view-part/?ref=snap
R27 = CMP-08839-029483-1: as R1 on sheet Sheet1; Series: ESR; Max Operating Temperature: 155°C; Case Code (Metric): 1608; Package Quantity: 1; Case/Package: 0603; Size Code: 0603; Case Code (Imperial): 0603; Min Operating Temperature: -55°C; Tolerance: 1%; Max Power Dissipation: 250mW; Number of Terminations: 2; RoHS Compliant: Yes; Lead Free: Lead Free; Packaging: Tape and Reel; Height: 0.022inch; Width: 0.031inch; Features: Automotive AEC-Q200; Resistor Type: Thick Film; Length: 0.063inch

## Nets that join several sheets
GND: Sheet1 (U2.11 U3.11), Sheet2 (24 pins), Sheet3 (J1.2 J2.2 R27.2)
NetC3_2: Sheet1 (11 pins), Sheet2 (C12.2 C13.2 R24.2 U4.6)
NetC8_1: Sheet1 (U1.7 U2.4 U3.4), Sheet2 (13 pins), Sheet3 (J1.1)
NetC9_1: Sheet2 (5 pins), Sheet3 (J3.2)
NetC9_2: Sheet2 (C9.2 DS2.2 U5.5), Sheet3 (J3.1)
NetC14_1: Sheet2 (6 pins), Sheet3 (J2.1)
NetC16_2: Sheet1 (U1.4), Sheet2 (C16.2 C17.2 C24.2 U7.3), Sheet3 (DS3.2)
NetJ1_3: Sheet2 (R21.2 U5.3), Sheet3 (J1.3)
NetJ1_4: Sheet2 (R20.2 U5.2), Sheet3 (J1.4)
NetJ1_7: Sheet1 (R10.1 U2.1), Sheet3 (J1.7)
NetJ3_3: Sheet2 (R23.2 U5.7), Sheet3 (J3.3)
NetJ3_4: Sheet2 (R22.2 U5.6), Sheet3 (J3.4)
NetJ4_1: Sheet1 (R17.1), Sheet3 (J4.1 J4.4)
NetJ4_2: Sheet1 (R4.1), Sheet3 (J4.2)
NetJ4_3: Sheet1 (R1.1), Sheet3 (J4.3)